# Altium schematic sheet U_ADCS_SunSensors.SchDoc
size A4; SheetNumber: 9; SheetTotal: 9
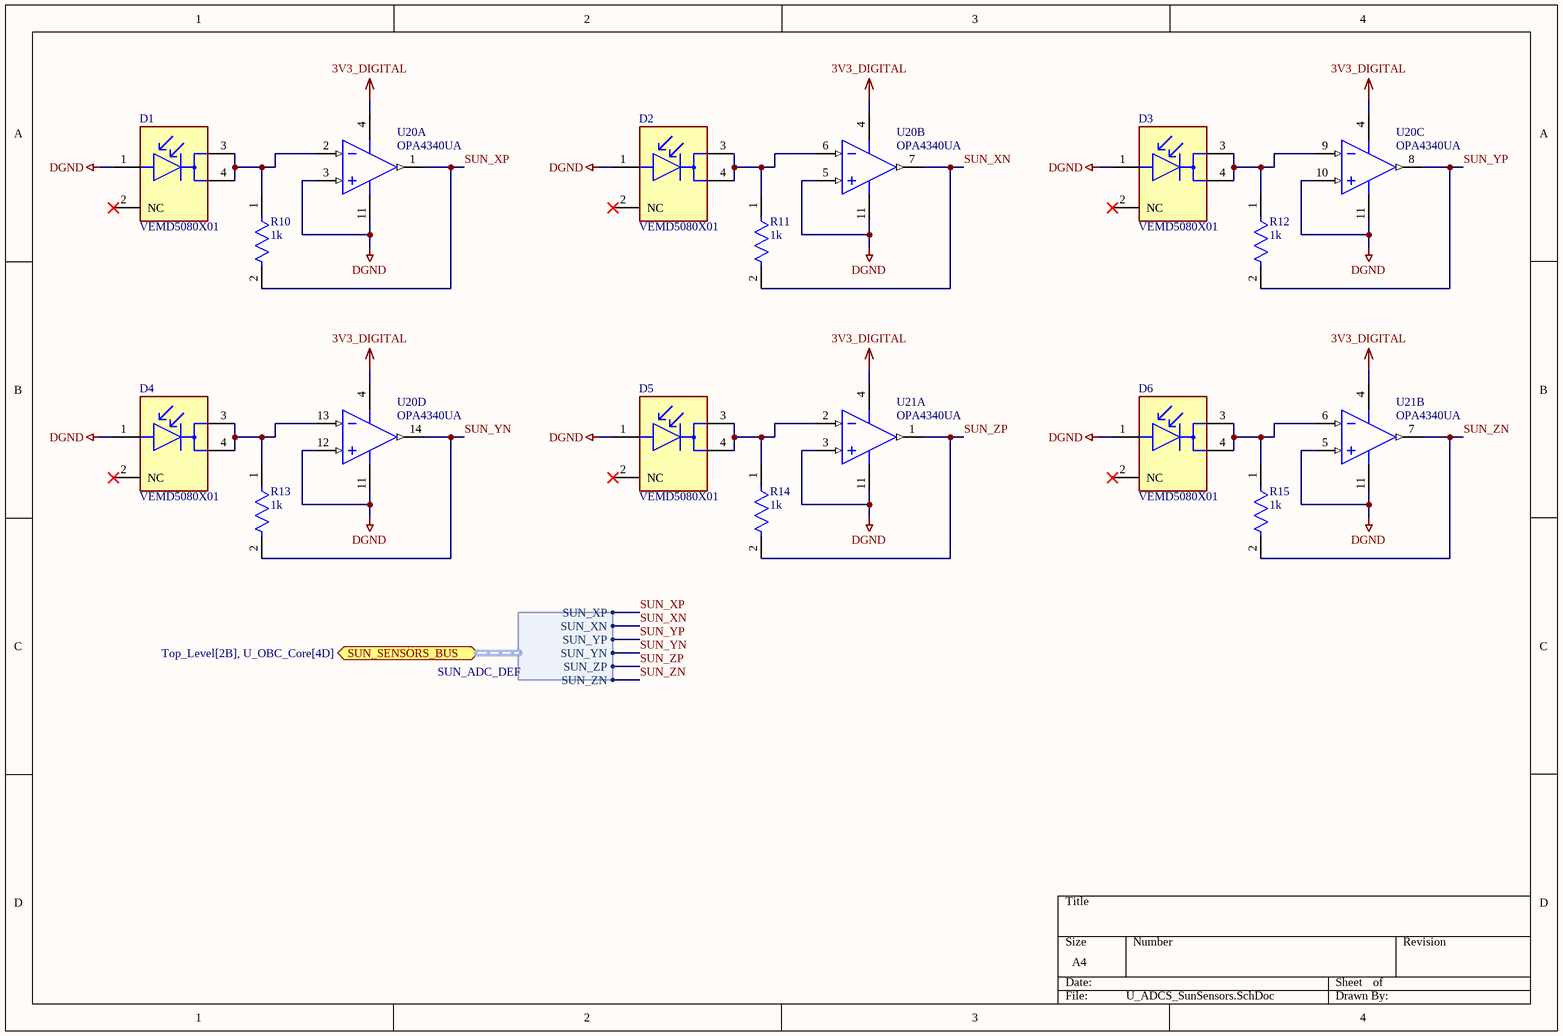
[diagram p0: U_ADCS_SunSensors.SchDoc]

## Parts
D1  VEMD5080X01  [FP-6_550-5329_01-4-MFG]
D2  VEMD5080X01  [FP-6_550-5329_01-4-MFG]
D3  VEMD5080X01  [FP-6_550-5329_01-4-MFG]
D4  VEMD5080X01  [FP-6_550-5329_01-4-MFG]
D5  VEMD5080X01  [FP-6_550-5329_01-4-MFG]
D6  VEMD5080X01  [FP-6_550-5329_01-4-MFG]
R10  1k  [FP-CRGCQ0603-IPC_C]
R11  1k  [FP-CRGCQ0603-IPC_C]
R12  1k  [FP-CRGCQ0603-IPC_C]
R13  1k  [FP-CRGCQ0603-IPC_C]
R14  1k  [FP-CRGCQ0603-IPC_C]
R15  1k  [FP-CRGCQ0603-IPC_C]
U20  OPA4340UA  [D0014A_N]  (parts A,B,C,D of 4)
U21  OPA4340UA  [D0014A_N]  (parts A,B of 4)

## Ports
SUN_SENSORS_BUS (bidir, harness SUN_ADC_DEF, see Top_Level[2B], U_OBC_Core[4D])

## Harnesses
SUN_ADC_DEF: SUN_XP, SUN_XN, SUN_YP, SUN_YN, SUN_ZP, SUN_ZN

## Nets
3V3_DIGITAL: U20.4(V+) U21.4(V+)
DGND: D1.1(A) D2.1(A) D3.1(A) D4.1(A) D5.1(A) D6.1(A) U20.3(IN_A+) U20.5(IN_B+) U20.10(IN_C+) U20.11(V-) U20.12(IN_D+) U21.3(IN_A+) U21.5(IN_B+) U21.11(V-)
SUN_XN: R11.2 U20.7(OUT_B) ; port SUN_SENSORS_BUS.SUN_XN
SUN_XP: R10.2 U20.1(OUT_A) ; port SUN_SENSORS_BUS.SUN_XP
SUN_YN: R13.2 U20.14(OUT_D) ; port SUN_SENSORS_BUS.SUN_YN
SUN_YP: R12.2 U20.8(OUT_C) ; port SUN_SENSORS_BUS.SUN_YP
SUN_ZN: R15.2 U21.7(OUT_B) ; port SUN_SENSORS_BUS.SUN_ZN
SUN_ZP: R14.2 U21.1(OUT_A) ; port SUN_SENSORS_BUS.SUN_ZP
NetD1_3: D1.3(C) D1.4(C) R10.1 U20.2(IN_A-)
NetD2_3: D2.3(C) D2.4(C) R11.1 U20.6(IN_B-)
NetD3_3: D3.3(C) D3.4(C) R12.1 U20.9(IN_C-)
NetD4_3: D4.3(C) D4.4(C) R13.1 U20.13(IN_D-)
NetD5_3: D5.3(C) D5.4(C) R14.1 U21.2(IN_A-)
NetD6_3: D6.3(C) D6.4(C) R15.1 U21.6(IN_B-)

Not connected (* = marked no-connect by the designer): D1 2(NC)*; D2 2(NC)*; D3 2(NC)*; D4 2(NC)*; D5 2(NC)*; D6 2(NC)*

## Library data of the parts
D1-D6 = CMP-02531-000007-1: PHOTODIODE 750 TO 1050 NM; Viewing Angle: 65°; Max Reverse Voltage (DC): 20V; Response Time: 70ns; Wavelength: 950nm; Diode Type: PIN; Min Operating Temperature: -40°C; RoHS Compliant: Yes; Max Operating Temperature: 110°C; Packaging: Tape and Reel; Mount: Surface Mount; Case/Package: SMD/SMT
R10-R15 = CMP-03211-008566-1: CRGCQ0603 1KΩ 1% ±100ppm/°C 75V; Manufacturer Part Number: CRGCQ0603F1K0; Manufacturer: TE Connectivity; Tolerance: 0.01; Power Rating: 0.1W; Device Class L3: Chip SMD Resistors; Height: 0.55mm; Lead Free: Yes; Value: 1KΩ; ComponentLink2Description: Datasheet; Category: Res; RoHS: TRUE; Series: CRGCQ; Ipc Land Pattern Name: RESC16080X45; Temperature: -55°C to +155°C; Device Class L2: Resistors; Package: CRGCQ0603; Ambient Temperature Range High: +70°C; Octopart: https://octopart.com/crgcq0603f1k0-te+connectivity-91018050; Temperature Range High: +155°C; ComponentLink2URL: https://www.te.com/commerce/DocumentDelivery/DDEController?Action=showdoc&DocId=Data+Sheet%7F1773204-3%7F1%7Fpdf%7FEnglish%7FENG_DS_1773204-3_1.pdf%7F4-2176339-694; Temperature Coefficient: ±100ppm/°C; Voltage Rating: 75V; Composition: Thick Film; Resistance: 1KΩ; Temperature Range Low: -55°C; Device Class L1: Passive Components
U20 U21 = CMP-0272-00100-3: Single-Supply, Rail-to-Rail Operational Amplifier MicroAmplifier(TM) Series, 2.7 to 5 V, -40 to 85 degC, 14-pin SOIC (D14), Green (RoHS & no Sb/Br); Manufacturer: Texas Instruments; Iq per channel(Max)(mA): 0.95; Sub Family: Low Input Bias Current Amp (<=10pA), Low Offset Voltage Amplifier (<=500uV), Low Supply Voltage Amplifier (<=2.7V), Precision Amplifier; Vn at 1kHz(Typ)(nV/rtHz): 25; Total Supply Voltage(Min)(+5V is 5, +/-5V is 10): 2.7; Slew Rate(Typ)(V/us): 6; Total Supply Voltage(Max)(+5V is 5, +/-5V is 10): 5; Number of Channels: 4; CMRR(Min)(dB): 80; Vio (25C)(Max)(mV): 0.5; Offset Drift(Typ)(uV/C): 2.5; IIB(Max)(pA): 10; ComponentLink1Description: Manufacturer URL; PackageDescription: 14-Pin Plastic Small Outline, Body 8.65 x 3.9 mm, Pitch 1.27 mm; ComponentLink2URL: http://www.ti.com/general/docs/lit/getliterature.tsp?genericPartNumber=OPA4340&fileType=pdf; Mounting Technology: Surface Mount; Code_JEDEC: MS-012; ComponentLink3URL: http://www.ti.com/lit/ml/mpds177g/mpds177g.pdf; ComponentLink3Description: Package Specification; ComponentLink1URL: http://www.ti.com/; ComponentLink2Description: Datasheet; Eco-Plan: Green (RoHS & no Sb/Br); PartNumber: OPA4340UA; PackageReference: D0014A; PackageVersion: 4040047-5/M, 06/2011; DatasheetVersion: SBOS073B